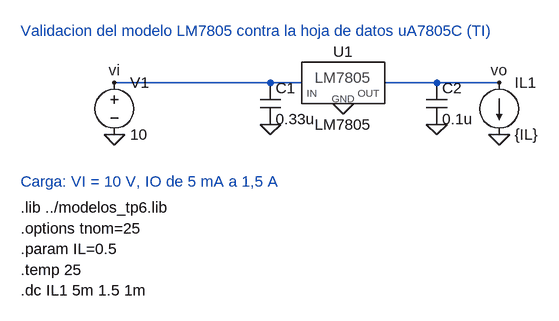
[diagram p0: schematic v2_carga.asc]
v2_carga.asc, the LTspice schematic file:
Version 4
SHEET 1 900 500
WIRE 160 96 400 96
WIRE 400 96 448 96
WIRE 576 96 656 96
WIRE 656 96 752 96
FLAG 160 176 0
FLAG 160 96 vi
FLAG 400 160 0
FLAG 512 128 0
FLAG 656 160 0
FLAG 752 176 0
FLAG 752 96 vo
SYMBOL voltage 160 80 R0
SYMATTR InstName V1
SYMATTR Value 10
SYMBOL cap 384 96 R0
SYMATTR InstName C1
SYMATTR Value 0.33u
SYMBOL LM7805 512 96 R0
SYMATTR InstName U1
SYMATTR Value LM7805
SYMBOL cap 640 96 R0
SYMATTR InstName C2
SYMATTR Value 0.1u
SYMBOL current 752 96 R0
SYMATTR InstName IL1
SYMATTR Value {IL}
TEXT 16 16 Left 2 ;Validacion del modelo LM7805 contra la hoja de datos uA7805C (TI)
TEXT 16 248 Left 2 ;Carga: VI = 10 V, IO de 5 mA a 1,5 A
TEXT 16 288 Left 2 !.lib ../modelos_tp6.lib
TEXT 16 320 Left 2 !.options tnom=25
TEXT 16 352 Left 2 !.param IL=0.5
TEXT 16 384 Left 2 !.temp 25
TEXT 16 416 Left 2 !.dc IL1 5m 1.5 1m

The netlist it stands for:
* v2_carga.asc
V1 vi 0 10
C1 vi 0 0.33u
XU1 vi 0 vo LM7805  ; pins IN GND OUT
C2 vo 0 0.1u
IL1 vo 0 {IL}
* Validacion del modelo LM7805 contra la hoja de datos uA7805C (TI)
* Carga: VI = 10 V, IO de 5 mA a 1,5 A
.lib ../modelos_tp6.lib
.options tnom=25
.param IL=0.5
.temp 25
.dc IL1 5m 1.5 1m
.backanno
.end